# Altium schematic sheet 01_Power.SchDoc
size A4; SheetNumber: 2; SheetTotal: 6
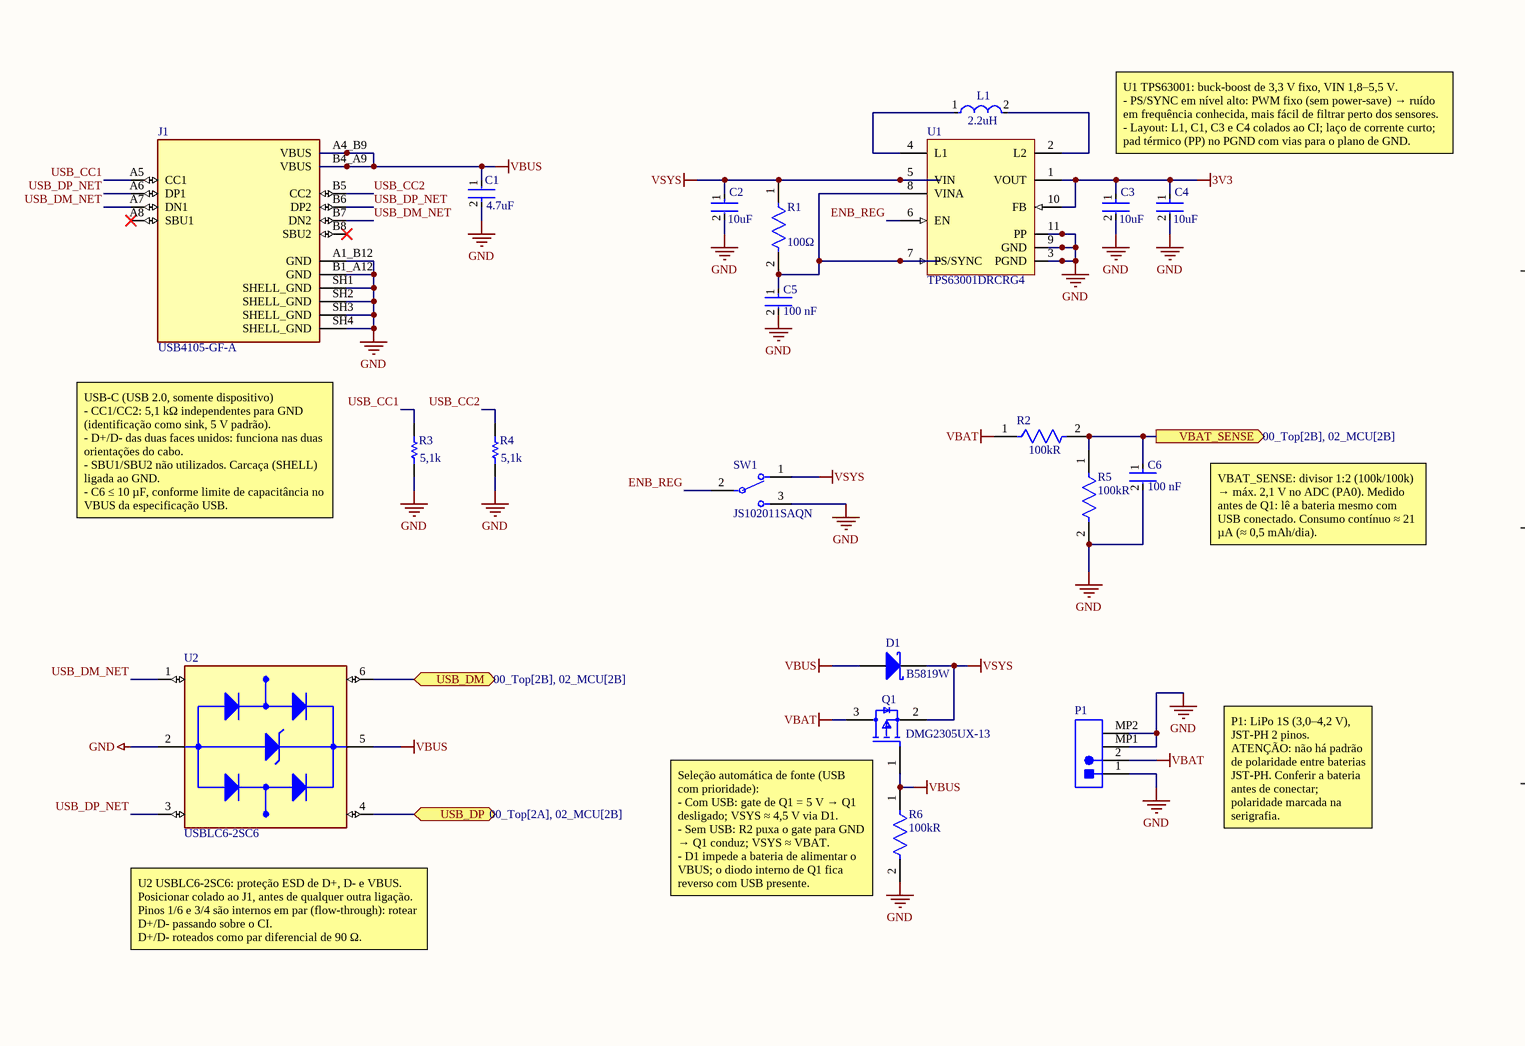
[diagram p0: 01_Power.SchDoc, left]
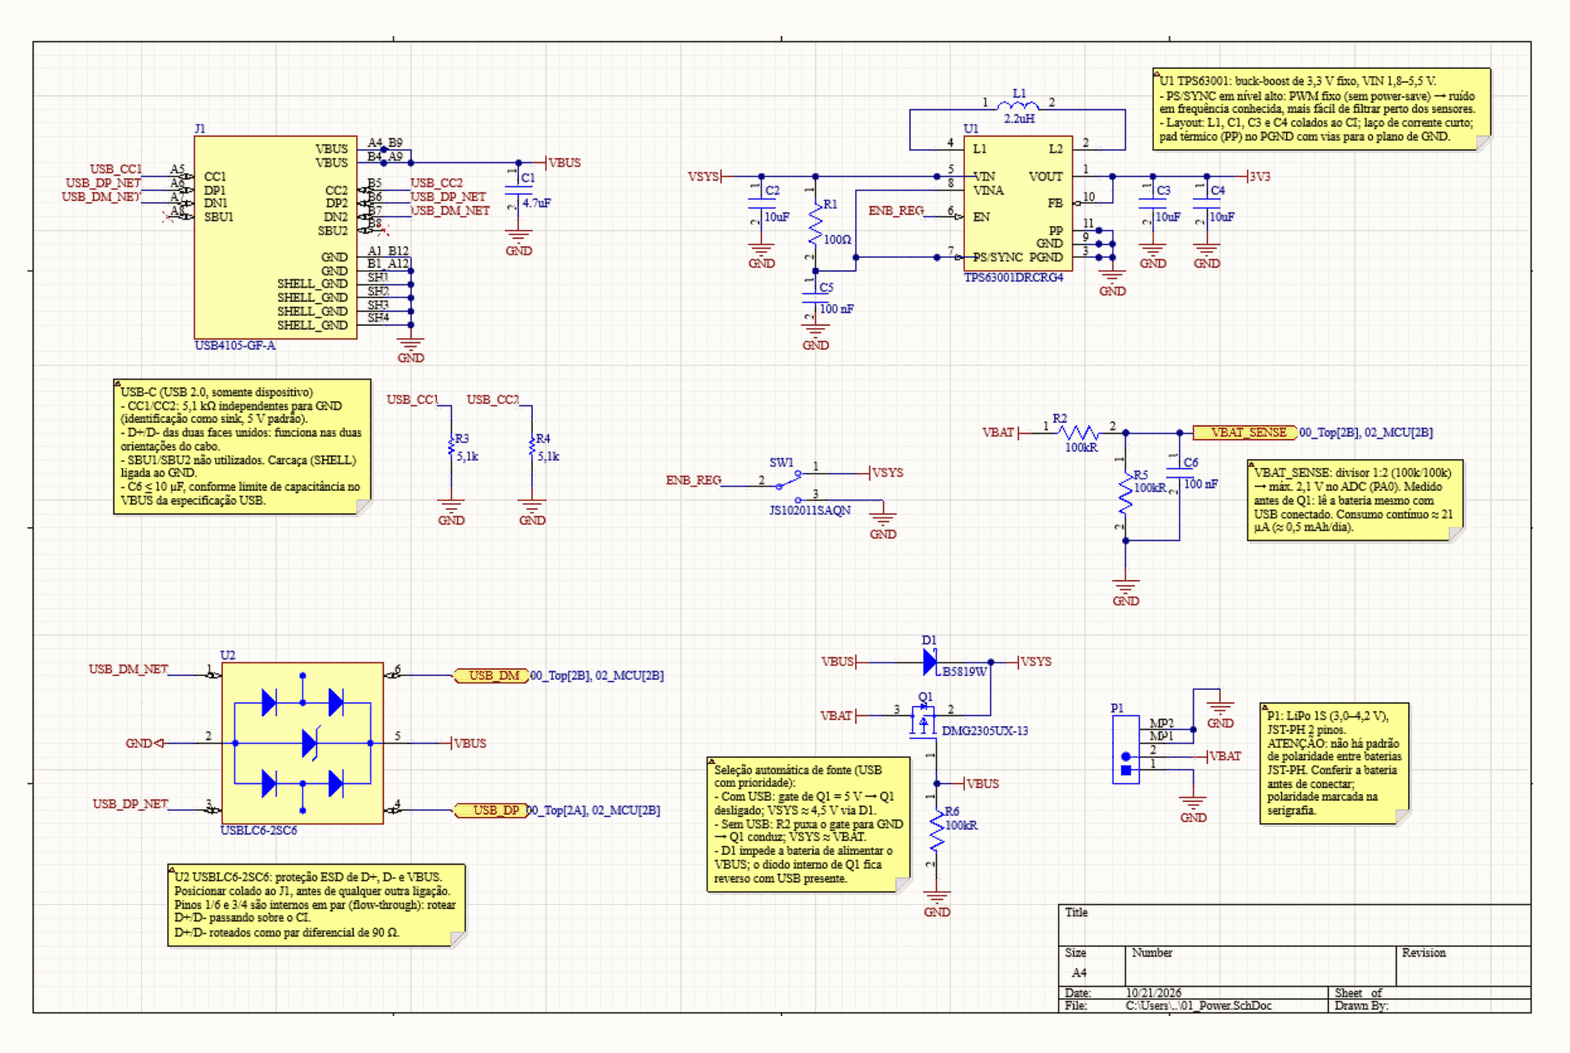
[diagram p1: 01_Power.SchDoc, right]

## Parts
C1  Capacitance: 4.7uF  [FP-GRM219-0_15-0_1-IPC_C]  (hidden comment: GRM219R61E475KA73D)
C2  value 10uF  [FP-GRM21B-0_2-e0_2_0_7-IPC_B]  (hidden comment: GRM21BZ71E106KE15K)
C3  value 10uF  [FP-GRM21B-0_2-e0_2_0_7-IPC_B]  (hidden comment: GRM21BZ71E106KE15K)
C4  value 10uF  [FP-GRM21B-0_2-e0_2_0_7-IPC_B]  (hidden comment: GRM21BZ71E106KE15K)
C5  Capacitance: 100 nF  [FP-CC0603-DA-MFG]  (hidden comment: CC0603KRX7R9BB104)
C6  Capacitance: 100 nF  [FP-CC0603-DA-MFG]  (hidden comment: CC0603KRX7R9BB104)
D1  B5819W  [MCC-SOD123_V]
J1  USB4105-GF-A  [GCT_USB4105-GF-A]
L1  value 2.2uH  [FP-VLS3012HBX-MFG]  (hidden comment: VLS3012HBX-2R2M)
P1  S2B-PH-SM4-TB(LF)(SN)  [JST- S2B-PH-SM4-TB(LF)(SN)-2_V]  (value not drawn)
Q1  DMG2305UX-13  [FP-SOT23-MFG]
R1  Resistance: 100Ω  [FP-RC0603-0_55-MFG]  (hidden comment: RC0603FR-07100RL)
R2  Resistance: 100kR  [FP-RC0603-0_55-MFG]  (hidden comment: RC0603FR-07100KL)
R3  value 5,1k  [RESC1608X55X25ML10T15]  (hidden comment: RC0603FR-075K1L)
R4  value 5,1k  [RESC1608X55X25ML10T15]  (hidden comment: RC0603FR-075K1L)
R5  Resistance: 100kR  [FP-RC0603-0_55-MFG]  (hidden comment: RC0603FR-07100KL)
R6  Resistance: 100kR  [FP-RC0603-0_55-MFG]  (hidden comment: RC0603FR-07100KL)
SW1  JS102011SAQN  [FP-JS102011SAQN-MFG]
U1  TPS63001DRCRG4  [DRC10-2400X1650TP]
U2  USBLC6-2SC6  [SOT95P280X145-6N]

## Ports
USB_DM (bidir, see 00_Top[2B], 02_MCU[2B]), USB_DP (bidir, see 00_Top[2A], 02_MCU[2B]), VBAT_SENSE (out, see 00_Top[2B], 02_MCU[2B])

## Nets
3V3: C3.1 C4.1 U1.1(VOUT) U1.10(FB)
GND: C1.2 C2.2 C3.2 C4.2 C5.2 C6.2 J1.A1_B12(GND) J1.B1_A12(GND) J1.SH1(SHELL_GND) J1.SH2(SHELL_GND) J1.SH3(SHELL_GND) J1.SH4(SHELL_GND) P1.1 P1.MP1 P1.MP2 R3.2 R4.2 R5.2 R6.2 SW1.3 U1.3(PGND) U1.9(GND) U1.11(PP) U2.2(GND)
VBAT: P1.2 Q1.3(D) R2.1
VBUS: C1.1 D1.1(A) J1.A4_B9(VBUS) J1.B4_A9(VBUS) Q1.1(G) R6.1 U2.5(VBUS)
VSYS: C2.1 D1.2(K) Q1.2(S) R1.1 SW1.1 U1.5(VIN)
ENB_REG: SW1.2(C) U1.6(EN)
USB_CC1: J1.A5(CC1) R3.1
USB_CC2: J1.B5(CC2) R4.1
USB_DM: U2.6(I/O1_OUT) ; port USB_DM
USB_DM_NET: J1.A7(DN1) J1.B7(DN2) U2.1(I/O1_IN)
USB_DP: U2.4(I/O2_OUT) ; port USB_DP
USB_DP_NET: J1.A6(DP1) J1.B6(DP2) U2.3(I/O2_IN)
VBAT_SENSE: C6.1 R2.2 R5.1 ; port VBAT_SENSE
NetC5_1: C5.1 R1.2 U1.7(PS/SYNC) U1.8(VINA)
NetL1_1: L1.1 U1.4(L1)
NetL1_2: L1.2 U1.2(L2)

Not connected (* = marked no-connect by the designer): J1 A8(SBU1)* B8(SBU2)*

## Notes on the sheet
- U1 TPS63001: buck-boost de 3,3 V fixo, VIN 1,8–5,5 V.
  - PS/SYNC em nível alto: PWM fixo (sem power-save) → ruído em frequência conhecida, mais fácil de filtrar perto dos sensores.
  - Layout: L1, C1, C3 e C4 colados ao CI; laço de corrente curto; pad térmico (PP) no PGND com vias para o plano de GND.
- USB-C (USB 2.0, somente dispositivo)
  - CC1/CC2: 5,1 kΩ independentes para GND (identificação como sink, 5 V padrão).
  - D+/D- das duas faces unidos: funciona nas duas orientações do cabo.
  - SBU1/SBU2 não utilizados. Carcaça (SHELL) ligada ao GND.
  - C6 ≤ 10 µF, conforme limite de capacitância no VBUS da especificação USB.
- VBAT_SENSE: divisor 1:2 (100k/100k) → máx. 2,1 V no ADC (PA0). Medido antes de Q1: lê a bateria mesmo com USB conectado. Consumo contínuo ≈ 21 µA (≈ 0,5 mAh/dia).
- P1: LiPo 1S (3,0–4,2 V), JST-PH 2 pinos.
  ATENÇÃO: não há padrão de polaridade entre baterias JST-PH. Conferir a bateria antes de conectar; polaridade marcada na serigrafia.
- (near Q1) Seleção automática de fonte (USB com prioridade):
  - Com USB: gate de Q1 = 5 V → Q1 desligado; VSYS ≈ 4,5 V via D1.
  - Sem USB: R2 puxa o gate para GND → Q1 conduz; VSYS ≈ VBAT.
  - D1 impede a bateria de alimentar o VBUS; o diodo interno de Q1 fica reverso com USB presente.
- U2 USBLC6-2SC6: proteção ESD de D+, D- e VBUS.
  Posicionar colado ao J1, antes de qualquer outra ligação.
  Pinos 1/6 e 3/4 são internos em par (flow-through): rotear D+/D- passando sobre o CI.
  D+/D- roteados como par diferencial de 90 Ω.

## Library data of the parts
C1 = CMP-06035-041247-1: Chip Multilayer Ceramic Capacitors for General Purpose, 0805, 4.7uF, X5R, 15%, 10%, 25V; Resistor Type: Ceramic; Weight: 0.000335oz; Mount: Surface Mount; Thickness: 0.037inch; Case Code (Metric): 2012; Packaging: Tape and Reel; Material: Ceramic; Voltage Rating: 25V; Length: 2mm; Package Quantity: 4000; Case/Package: 0805; Height: 0.85mm; Termination: SMD/SMT; Tolerance: 10%; Dielectric: X5R; Width: 1.25mm; Max Operating Temperature: 85°C; Case Code (Imperial): 0805; Min Operating Temperature: -55°C; Voltage Rating (DC): 25V
C2-C4 = CMP-06035-042430-1: Chip Multilayer Ceramic Capacitors for General Purpose, 0805, 10uF, X7R, 15%, 10%, 25V; Case/Package: 0805
C5 C6 = CMP-2100-03601-2: CAP CER 0.1UF 50V X7R 0603; Manufacturer: YAGEO; Material: Ceramic; Temperature Coefficient: 15%; Tolerance: 0.1; Value: 100 nF; Height: 0.9mm; Voltage: 50 V; ComponentLink2Description: Datasheet; Device Class L2: Capacitors; Temperature Range High: +125°C; Category: Cap; Footprint Url: http://www.yageo.com/exep/pages/download/literatures/UPY-C_GEN_24.pdf; ComponentLink2URL: http://www.yageo.com/documents/recent/UPY-GPHC_X7R_6.3V-to-50V_18.pdf; Package: CC0603-DA; Temperature: -55°C to +125°C; Voltage Rating: 50 V; Temperature Characteristic: X7R; Device Class L1: Passive Components; Temperature Range Low: -55°C; Manufacturer Part Number: CC0603KRX7R9BB104; RoHS: TRUE; Automotive: No; Device Class L3: Ceramic Capacitors; Octopart: https://octopart.com/cc0603krx7r9bb104-yageo-42244635; Mouser Description: Multilayer Ceramic Capacitor, CC Series, 0.1 - F, - 10%, X7R, 50 V, 0603 [1608 Metric]; Lead Free: Yes; Digikey Description: CAP CER 0.1UF 50V X7R 0603
D1 = CMP-004-00005-2: Schottky Barrier Rectifier, 40 V, 1 A, -65 to 125 degC, 2-Pin SOD123, RoHS, Tape and Reel; Manufacturer: Micro Commercial Components; Datasheet Version: Rev. B, 01/2013; RoHS Compliant: Unknown; Manufacturer URL: http://www.mccsemi.com/; Package URL: http://www.mccsemi.com/up_pdf/1N4448W(SOD-123).pdf; Case/Package: SOD123; Mounting Technology: SM; Datasheet URL: http://www.mccsemi.com/up_pdf/B5817W-B5819W(SOD-123).pdf; Package Description: 2-Pin Small Outline Diode, Body 2.7 x 1.6 mm, Height 1.35 mm; Package Reference: SOD123
J1 = USB4105-GF-A: Conector USB-C 2.0, receptáculo de 16 pinos, montagem SMT/TH; Manufacturer: GCT; Manufacturer Part Number: USB4105-GF-A; Datasheet: https://gct.co/connector/usb4105
L1 = CMP-08253-000022-1: FIXED IND 2.2UH 3.15A 106 MOHM; Manufacturer: TDK; Tolerance: 20%; Shielding: true; Core Material: Metal; Rms Current: 3.35A; Test Frequency: 1MHz; Saturation Current: 3.76A; Series Resistance: 106mΩ; RoHS: TRUE; Octopart: https://octopart.com/vls3012hbx-2r2m-tdk-83930104; Temperature: -40°C to +105°C; Temperature Range High: +105°C; Device Class L2: Inductors; Height: 1.2mm; Temperature Range Low: -40°C; Lead Free: Yes; Digikey Description: FIXED IND 2.2UH 3.15A 106 MOHM; Automotive: No; ComponentLink2Description: Datasheet; Inductance: 2.2uH; Package: VLS3012HBX; Category: Ind; Manufacturer Part Number: VLS3012HBX-2R2M; Composition: Wirewound; ComponentLink2URL: https://product.tdk.com/info/en/catalog/datasheets/inductor_commercial_power_vls3012hbx_en.pdf; Device Class L3: Fixed Inductors; Device Class L1: Passive Components
P1 = CMP-002-00031-2: Male Header, Pitch 2 mm, 1 x 2 Position, Height 5.5 mm, -25 to 85 degC, RoHS, Tape and Reel; Manufacturer: JST; Package Reference: S2B-PH-SM4-TB(LF)(SN)-2; Mounting Technology: SM; Manufacturer URL: http://www.jst.com/home2.html; Package Description: Male Header, Pitch 2 mm, 1 x 2 Position, Height 5.5 mm; Max Operating Temperature: 85°C; Case/Package: S2B-PH-SM4-TB(LF)(SN)-2; Datasheet URL: http://www.jst-mfg.com/product/pdf/eng/ePH.pdf; Connector Type: Header; RoHS Compliant: Unknown; Datasheet Version: Dec-12; Gender: Male; Min Operating Temperature: -25°C
Q1 = CMP-12801-000021-1: MOSFET P-CH 20V 4.2A SOT23; Manufacturer: Diodes Inc.; Input Capacitace At Vds: 808pF @ -15V; Rthja Max: 90°C/W; Drain To Source Voltage: -20V; Standoff Height: 0.013mm; Number Of P Channels: 1; Gate To Source Voltage: 8V; Turn On Delay Time: 10.8ns; Pulse Drain Current: -15A; Threshold Vgs Max: -0.9V; Max Junction Temp: +150°C; Depletion Mode: False; Drain To Source Resistance: 40mΩ; Threshold Vgs Min: -0.5V; Continuous Drain Current: -4.2A; Turn Off Delay Time: 79.3ns; Gate Charge At Vgs: 10.2nC @ -4.5V; Power Dissipation: 1.4W; Digikey Description: MOSFET P-CH 20V 4.2A SOT23; Temperature Range High: +150°C; Height: 1.1mm; Package: SOT23; Footprint Url: https://www.diodes.com/assets/Package-Files/SOT23.pdf; Device Class L3: MOSFETs; RoHS: TRUE; Temperature: -55°C to +150°C; Mouser Description: MOSFET P-Ch ENH FET -20V 52mOhm -5.0V; Temperature Range Low: -55°C; ComponentLink2Description: Datasheet; Manufacturer Part Number: DMG2305UX-13; Octopart: https://octopart.com/dmg2305ux-13-diodes+inc.-29925594; Ipc Land Pattern Name: SOT92P240X102-3; Device Class L2: Transistors; Automotive: No; Number Of Channels: 1; Drain To Source Breakdown Voltage: -20V; Lead Free: Yes; Device Class L1: Discrete Semiconductors; Category: Trans; ComponentLink2URL: https://www.diodes.com/assets/Datasheets/DMG2305UX.pdf
R1 = CMP-2100-03663-2: NexarPartId: 55402879; Voltage Rating: 50V; Power Rating: 100mW; Tolerance: 1%; Temperature Coefficient: 100ppm/°C; Case/Package: 0603; Military Standard: Not; REACH SVHC: Unknown; Case Code (Metric): 0603; Max Operating Temperature: 155°C; Schedule B: 8533210045, 8533210045; Height: 450µm; Length: 1.6mm; Lead Free: Lead Free; Packaging: Tape & Reel; Case Code (Imperial): 0603; Composition: Thick Film; Min Operating Temperature: -55°C; Voltage Rating (DC): 50V; RoHS: Compliant; Depth: 800µm; Number of Pins: 2; Termination: SMD/SMT; Width: 800µm
R2 R5 R6 = CMP-2100-03662-2: RES SMD 100K OHM 1% 1/10W 0603; Voltage Rating (DC): 50V; Max Power Dissipation: 100mW; Temperature Coefficient: 100ppm/°C; Working Voltage: 75V; Length: 1.6mm; Lead Free: Lead Free; Number of Terminations: 2; Packaging: Tape and Reel; Voltage Rating: 50V; Termination: SMD/SMT; Width: 0.8mm; Resistor Type: Thick Film; Resistance Tolerance: 1%; Features: Moisture Resistant; Height: 0.45mm; Construction: Rectangular; Case/Package: 0603; Military Standard: Not; Case Code (Imperial): 0603; Series: RC; Technology: THICK FILM; Depth: 0.8mm; RoHS Compliant: Yes; REACH SVHC: No SVHC; Min Operating Temperature: -55°C; Case Code (Metric): 1608; Max Operating Temperature: 155°C; Power Rating: 100mW; Number of Pins: 2; Tolerance: 1%
R3 R4 = CMP-2000-04091-1: Manufacturer: Yageo; Part Number: RC0603FR-075K1L
SW1 = CMP-2000-06501-2: SWITCH SLIDE SPDT 300MA 6V; Switch Function: On-On; Illumination Type: Non-Illuminated; Switch Travel: 2mm; Contact Resistance: 70mR; Actuator Material: Nylon; Electrical Life: 5000Cycles; Actuator Type: Standard; Max Operating Temperature: 85°C; Housing Material: Nylon; Radiation Hardening: No; Max Voltage Rating (DC): 6V; Package Quantity: 1; Case/Package: 100; Actuator Length: 2mm; Min Operating Temperature: -40°C; Contact Current Rating: 300mA; REACH SVHC: No SVHC; Throw Configuration: SPDT; Packaging: Tape and Reel; Contact Material: Copper Alloy; Max Current Rating: 300mA; Current Rating: 300mA; Mount: Surface Mount; Lead Free: Lead Free; Termination: Gull Wing; Voltage Rating (DC): 6V; Length: 9mm; Orientation: Right Angle; Contact Plating: Silver
U1 = CMP-0345-00003-1: Buck-Boost Voltage Converter with 1.8 to 5.5 V Input and 3.3 V Output, -40 to 85 degC, 10-Pin SON (DRC), Green (RoHS & no Sb/Br); Manufacturer: Texas Instruments; Vin(Min)(V): 1.8; Regulated Outputs(#): 1; Vout(Min)(V): 3.3; Switching Frequency(Max)(kHz): 1500; Iq(Typ)(mA): 0.03; Synchronous Rectification: TRUE; Iout(Max)(A): 1.2; SubFamily: Buck-Boost Regulator; Vin(Max)(V): 5.5; PartNumber: TPS63001DRCRG4; PackageVersion: revL, Sep-2011; ComponentLink1Description: Datasheet; PackageDescription: 10-Pin Plastic Small Outline No-Lead, 3 x 3 x 1 mm Body, 0.5 mm Pitch, Exposed Pad; ComponentLink2URL: http://www.ti.com/litv/pdf/mpds117k; ComponentLink1URL: http://www.ti.com/general/docs/lit/getliterature.tsp?genericPartNumber=TPS63001&fileType=pdf; ComponentLink2Description: Package Specification; Preset Vout(V): 3.3; Topology: Buck-Boost; Eco-Plan: Green (RoHS & no Sb/Br); PackageReference: DRC10-2400X1650TP; Mounting Technology: Surface Mount; DatasheetVersion: SLVS520B; Dynamic Voltage Scaling: TRUE; Vout(Max)(V): 3.3
U2 = USBLC6-2SC6: 17V Clamp 5A (8/20Âµs) Ipp Tvs Diode Surface Mount SOT-23-6; MF: STMicroelectronics; SnapEDA_Link: https://www.snapeda.com/parts/USBLC6-2SC6/STMicroelectronics/view-part/?ref=snap; Check_prices: https://www.snapeda.com/parts/USBLC6-2SC6/STMicroelectronics/view-part/?ref=eda; Purchase-URL: https://pricing.snapeda.com/search/part/USBLC6-2SC6/?ref=eda; Price: None; Availability: In Stock; Package: SOT-23-6 STMicroelectronics; MP: USBLC6-2SC6